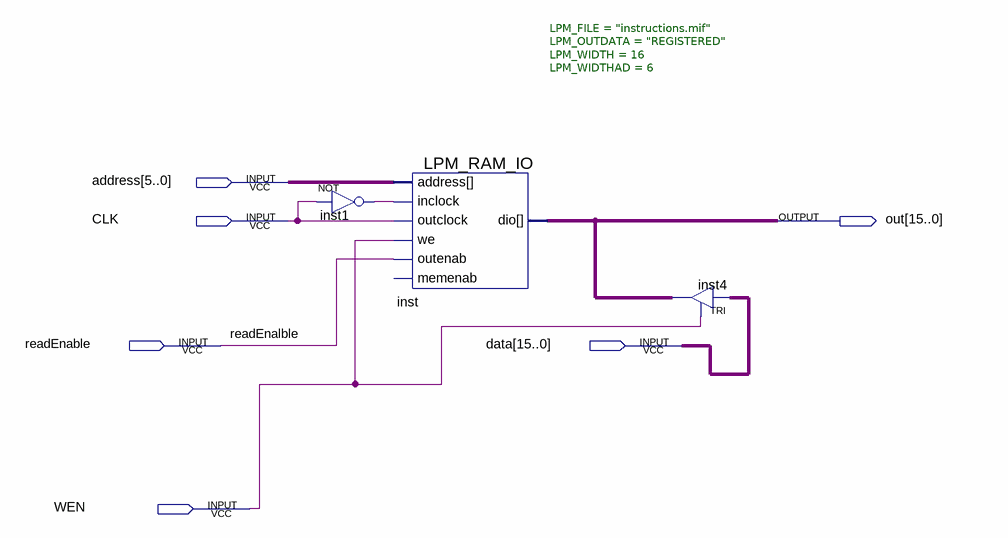
[diagram p0: schematic sheet]
// Quartus schematic InstructionMemory.bdf as structural Verilog: 3 symbols, 6 pins
module InstructionMemory (
  input  [5:0] address,
  input  CLK,
  input  readEnable,
  input  [15:0] data,
  input  WEN,
  output [15:0] out
);

  wire inst1_out;

  not inst1 (inst1_out, CLK);
  LPM_RAM_IO #(.LPM_FILE("instructions.mif"), .LPM_OUTDATA("REGISTERED"), .LPM_WIDTH(16), .LPM_WIDTHAD(6)) inst (
    .address(address), .outclock(CLK), .inclock(inst1_out), .we(WEN), .outenab(readEnable), .dio(out));  // open: memenab
  TRI inst4[15:0] (.IN(data), .OE(WEN), .OUT(out));

  // Other names for the same wires on the sheet: readEnalble = readEnable
endmodule
